# Altium project PCB_Bottom.PrjPcb
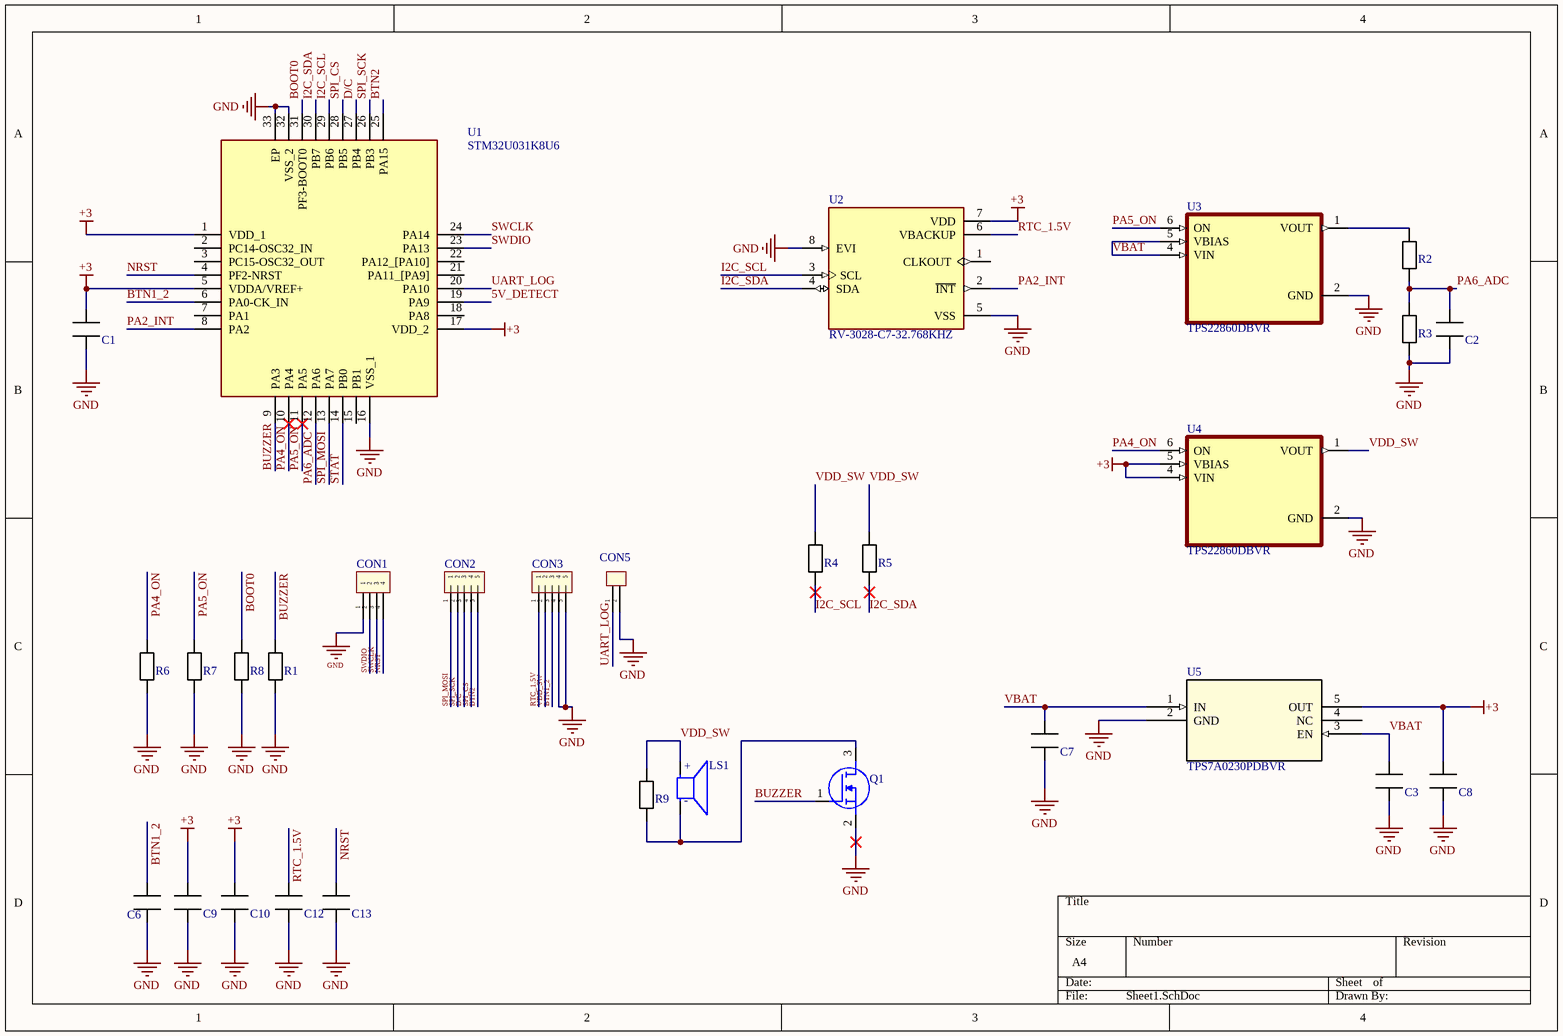
[diagram p0: Sheet1.SchDoc]
2 sheets, 49 parts. Net scope: global (net labels, ports and power ports of the same name join across sheets).
Board file: PCB2.PcbDoc
Sheets:
  Sheet1.SchDoc
  Sheet2.SchDoc

## Sheet Sheet1.SchDoc
size A4; SheetNumber: 1; SheetTotal: 2

### Parts
C1  CAP_0402  [CAP_0402]  (value not drawn)
C2  CAP_0402  [CAP_0402]  (value not drawn)
C3  CAP_0402  [CAP_0402]  (value not drawn)
C6  CAP_0402  [CAP_0402]  (value not drawn)
C7  CAP_0402  [CAP_0402]  (value not drawn)
C8  CAP_0402  [CAP_0402]  (value not drawn)
C9  CAP_0402  [CAP_0402]  (value not drawn)
C10  CAP_0402  [CAP_0402]  (value not drawn)
C12  CAP_0402  [CAP_0402]  (value not drawn)
C13  CAP_0402  [CAP_0402]  (value not drawn)
CON1  CON_1x4_2mm  [CON_1x4_2mm]  (value not drawn)
CON2  CON_1x6_2mm  [CON_1x5_2mm]  (value not drawn)
CON3  CON_1x6_2mm  [CON_1x5_2mm]  (value not drawn)
CON5  1x4 2.54mm THT  [CON_1x2_2mm]  (value not drawn)
LS1  Buzzer_Capacitive_5020  [Buzzer_5020]  (value not drawn)
Q1  c  [SOT50P160X80-3N]  (value not drawn)
R1  RES_0402  [RES_0402]  (value not drawn)
R2  RES_0402  [RES_0402]  (value not drawn)
R3  RES_0402  [RES_0402]  (value not drawn)
R4  RES_0402  [RES_0402]  (value not drawn)
R5  RES_0402  [RES_0402]  (value not drawn)
R6  RES_0402  [RES_0402]  (value not drawn)
R7  RES_0402  [RES_0402]  (value not drawn)
R8  RES_0402  [RES_0402]  (value not drawn)
R9  RES_0402  [RES_0402]  (value not drawn)
U1  STM32U031K8U6  [QFN50P500X500X60-33N-D]
U2  RV-3028-C7-32.768KHZ  [IC_RV-3028-C7-32.768KHZ-1PPM-TA-QA - duplicate]
U3  TPS22860DBVR  [SOT95P280X145-6N]
U4  TPS22860DBVR  [SOT95P280X145-6N]
U5  TPS7A0230PDBVR  [SOT23_DBV_TEX]

### Nets
+3: C1.2 C8.2 C9.1 C10.1 U1.1(VDD_1) U1.5(VDDA/VREF+) U1.17(VDD_2) U2.7(VDD) U4.4(VIN) U4.5(VBIAS) U5.5(OUT)
GND: C1.1 C2.1 C3.1 C6.1 C7.1 C8.1 C9.2 C10.2 C12.2 C13.2 CON1.1 CON3.4 CON3.5 CON5.2 Q1.2(S) R1.1 R3.1 R6.1 R7.1 R8.1 U1.16(VSS_1) U1.32(VSS_2) U1.33(EP) U2.5(VSS) U2.8(EVI) U3.2(GND) U4.2(GND) U5.2(GND)
5V_DETECT: U1.19(PA9)
BOOT0: R8.2 U1.31(PF3-BOOT0)
BTN1_2: C6.2 CON3.3 U1.6(PA0-CK_IN)
BTN2: CON2.5 U1.25(PA15)
BUZZER: Q1.1(G) R1.2 U1.9(PA3)
D/C: CON2.3 U1.27(PB4)
I2C_SCL: R4.1 U1.29(PB6) U2.3(SCL)
I2C_SDA: R5.1 U1.30(PB7) U2.4(SDA)
NRST: C13.1 CON1.4 U1.4(PF2-NRST)
PA2_INT: U1.8(PA2) U2.2(~{INT})
PA4_ON: R6.2 U1.10(PA4) U4.6(ON)
PA5_ON: R7.2 U1.11(PA5) U3.6(ON)
PA6_ADC: C2.2 R2.1 R3.2 U1.12(PA6)
RTC_1.5V: C12.1 CON3.1 U2.6(VBACKUP)
SPI_CS: CON2.4 U1.28(PB5)
SPI_MOSI: CON2.1 U1.13(PA7)
SPI_SCK: CON2.2 U1.26(PB3)
STAT: U1.14(PB0)
SWCLK: CON1.3 U1.24(PA14)
SWDIO: CON1.2 U1.23(PA13)
UART_LOG: CON5.1 U1.20(PA10)
VBAT: C3.2 C7.2 U3.4(VIN) U3.5(VBIAS) U5.1(IN) U5.3(EN)
VDD_SW: CON3.2 LS1.P R4.2 R5.2 R9.2 U4.1(VOUT)
NetLS1_N: LS1.N Q1.3(D) R9.1
NetR2_2: R2.2 U3.1(VOUT)

Not connected (* = marked no-connect by the designer): U1 2(PC14-OSC32_IN) 3(PC15-OSC32_OUT) 7(PA1) 15(PB1) 18(PA8) 21(PA11_[PA9]) 22(PA12_[PA10]); U2 1(CLKOUT); U5 4(NC)

### Notes on the sheet
- (in symbol Buzzer_Capacitive_5020) +; -

### Library data of the parts
C1 C3 C6 C9 C10 C12 C13 = CAP_0402: val: 100n
C2 = CAP_0402: val: 10n
C7 = CAP_0402: val: 1u
C8 = CAP_0402: val: 4.7u
CON2 CON3 = CON_1x5_2mm
CON5 = CON_1x2_2.0mm: CON_1x2_2.54mm_THT; note: any manufacturer; val: 1x4 2.54mm THT
LS1 = Buzzer_Capacitive_5020: Buzzers Transducer, Externally Driven Magnetic 3 V 30mA 4kHz 75dB @ 3V, 10cm Surface Mount Solder Pads; MF: Same Sky; MP: CMT-0502-03-SMT-TR; SnapEDA_Link: https://www.snapeda.com/parts/CMT-0502-03-SMT-TR/Same+Sky/view-part/?ref=snap; Package: Package; Value: *; Check_prices: https://www.snapeda.com/parts/CMT-0502-03-SMT-TR/Same+Sky/view-part/?ref=eda
Q1 = DMG1012T-7: MOSFET N-Channel 20V 0.63A SOT523 | Diodes Inc DMG1012T-7; MF: Diodes Inc.; SnapEDA_Link: https://www.snapeda.com/parts/DMG1012T-7/Diodes+Inc./view-part/?ref=snap; Package: SOT-523 Diodes Inc.; Value: *; MP: DMG1012T-7; Check_prices: https://www.snapeda.com/parts/DMG1012T-7/Diodes+Inc./view-part/?ref=eda
R1 R6 R7 = RES_0402: val: 1M
R2 R3 = RES_0402: val: 100k
R4 R5 = RES_0402: val: 4.7k
R8 = RES_0402: val: 10k
R9 = RES_0402: val: 1k
U1 = STM32U031K8U6: Ultra-low-power features (ultra-low-power devices)  1.71 V to 3.6 V power supply  -40 C to 85/125 C temperature range  VBAT mode: 130 nA (with RTC and 9 x 32-bit backup registers)  Shutdown mode (4 wake-up pins): 16 nA  Standby mode (4 wake-up pins): 160 nA with RTC, 30 nA without RTC  Stop 2 mode: 630 nA with RTC, 515 nA without RTC  Run mode (LDO mode): 52 uA/MHz  Batch acquisition mode (BAM)  4 us wake-up from Stop mode  Brownout reset (BOR); Manufacturer_Name: STMicroelectronics; Geometry.Height: 0.6mm; Manufacturer_Part_Number: STM32U031K8U6; Mouser Part Number: 511-STM32U031K8U6; Mouser Price/Stock: https://www.mouser.co.uk/ProductDetail/STMicroelectronics/STM32U031K8U6?qs=dbcCsuKDzFUeNQ2GzBLCmw%3D%3D; Arrow Part Number: STM32U031K8U6; Arrow Price/Stock: https://www.arrow.com/en/products/stm32u031k8u6/stmicroelectronics.html?utm_currency=USD&region=nac; Datasheet Link: https://www.st.com/resource/en/datasheet/stm32u031f4.pdf
U2 = RV-3028-C7-32.768KHZ-1PPM-TA-QA: Extreme Low Power RTC Module; MF: {'manufacturer': u'Micro Crystal'}; Package: None; Price: None; Value: *; MP: RV-3028-C7-32.768KHZ-1PPM-TA-QA; Availability: Unavailable
U3 U4 = TPS22860DBVR: 0.73-â„¦, 5-V, ultra-low leakage load switch; MF: Texas Instruments; SnapEDA_Link: https://www.snapeda.com/parts/TPS22860DBVR/Texas+Instruments/view-part/?ref=snap; Package: SOT-23-6 Texas Instruments; Value: *; MP: TPS22860DBVR; Check_prices: https://www.snapeda.com/parts/TPS22860DBVR/Texas+Instruments/view-part/?ref=eda
U5 = TPS7A0230PDBVR: 200mA, nanopower-IQ (25 nA), low-dropout (LDO) voltage regulator with enable 5-SOT-23 -40 to 125; Manufacturer_Name: Texas Instruments; Copyright: Copyright (C) 2026 Ultra Librarian. All rights reserved.; Manufacturer_Part_Number: TPS7A0230PDBVR; RefDes: RefDes; Type: Type

## Sheet Sheet2.SchDoc
size A4; SheetNumber: 2; SheetTotal: 2
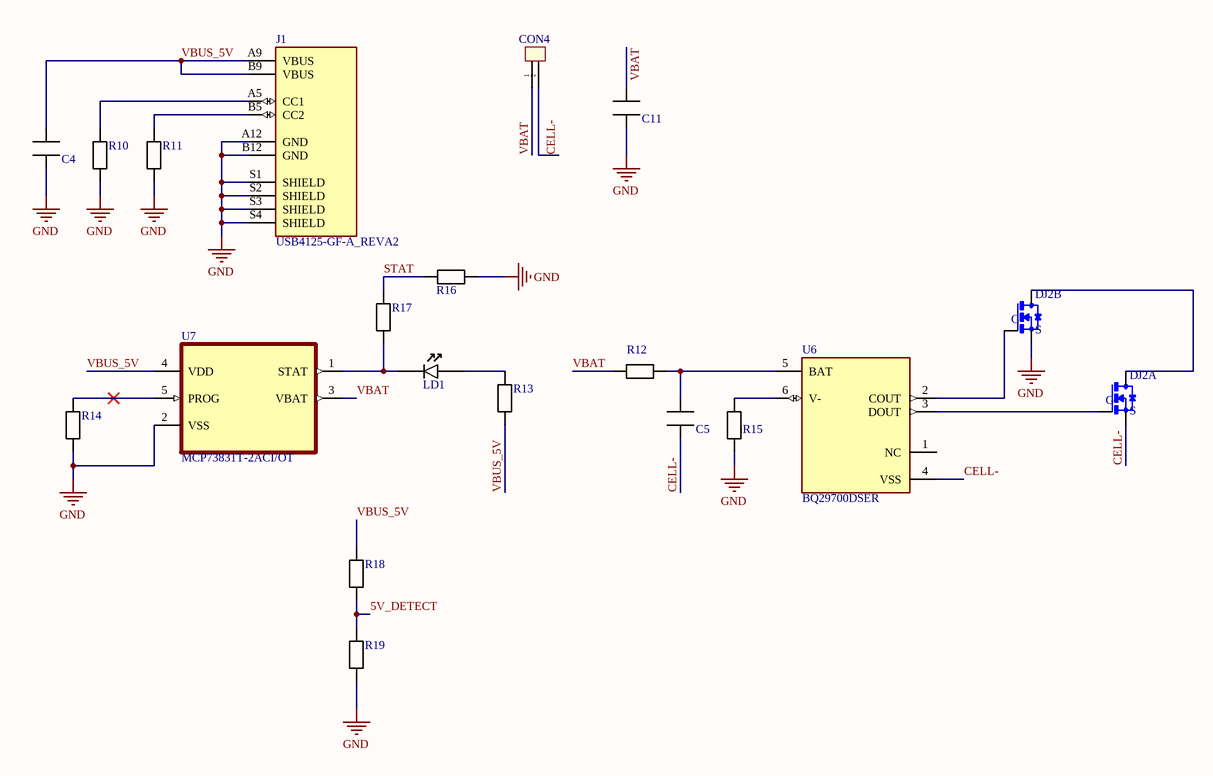
[diagram p1: Sheet2.SchDoc]

### Parts
C4  CAP_0402  [CAP_0402]  (value not drawn)
C5  CAP_0402  [CAP_0402]  (value not drawn)
C11  CAP_0402  [CAP_0402]  (value not drawn)
CON4  1x4 2.54mm THT  [CON_1x2_2.54MM_THT]  (value not drawn)
J1  USB4125-GF-A_REVA2  [GCT_USB4125-GF-A_REVA2]
J2  FDC6305N  [SSOT-6]  (value not drawn)  (parts A,B of 2)
LD1  LED_0402  [LED_0402]  (value not drawn)
R10  RES_0402  [RES_0402]  (value not drawn)
R11  RES_0402  [RES_0402]  (value not drawn)
R12  RES_0402  [RES_0402]  (value not drawn)
R13  RES_0402  [RES_0402]  (value not drawn)
R14  RES_0402  [RES_0402]  (value not drawn)
R15  RES_0402  [RES_0402]  (value not drawn)
R16  RES_0402  [RES_0402]  (value not drawn)
R17  RES_0402  [RES_0402]  (value not drawn)
R18  RES_0402  [RES_0402]  (value not drawn)
R19  RES_0402  [RES_0402]  (value not drawn)
U6  BQ29700DSER  [SON50P150X150X80-6N]
U7  MCP73831T-2ACI/OT  [SOT95P280X145-5N]

### Nets
GND: C4.1 C11.2 J1.A12(GND) J1.B12(GND) J1.S1(SHIELD) J1.S2(SHIELD) J1.S3(SHIELD) J1.S4(SHIELD) J2.2(S) R10.1 R11.1 R14.1 R15.2 R16.1 R19.1 U7.2(VSS)
5V_DETECT: R18.1 R19.2
CELL-: C5.1 CON4.2 J2.5(S) U6.4(VSS)
STAT: R16.2 R17.2
VBAT: C11.1 CON4.1 R12.2 U7.3(VBAT)
VBUS_5V: C4.2 J1.A9(VBUS) J1.B9(VBUS) R13.1 R18.2 U7.4(VDD)
NetC5_2: C5.2 R12.1 U6.5(BAT)
NetJ1_A5: J1.A5(CC1) R10.2
NetJ1_B5: J1.B5(CC2) R11.2
NetJ2_1: J2.1(G) U6.3(DOUT)
NetJ2_3: J2.3(G) U6.2(COUT)
NetJ2_4: J2.4(D) J2.6(D)
NetLD1_1: LD1.1 R17.1 U7.1(STAT)
NetLD1_2: LD1.2 R13.2
NetR14_2: R14.2 U7.5(PROG)
NetR15_1: R15.1 U6.6(V-)

Not connected (* = marked no-connect by the designer): U6 1(NC)

### Library data of the parts
C4 C11 = CAP_0402: val: 4.7u
C5 = CAP_0402: val: 100n
CON4 = CON_1x2_2.54mm_THT: note: any manufacturer; val: 1x4 2.54mm THT
J2 = FDC6305N: Mosfet Array 2 N-Channel (Dual) 20V 2.7A 700mW Surface Mount SuperSOTâ„¢-6; MF: ON Semiconductor; SnapEDA_Link: https://www.snapeda.com/parts/FDC6305N/Onsemi/view-part/?ref=snap; Package: TSOT-23-6 ON Semiconductor; Value: *; MP: FDC6305N; Check_prices: https://www.snapeda.com/parts/FDC6305N/Onsemi/view-part/?ref=eda
R10 R11 = RES_0402: val: 5.1k
R12 = RES_0402: val: 330
R13 = RES_0402: val: 1k
R14 = RES_0402: val: 62k
R15 = RES_0402: val: 2.2k
R16-R19 = RES_0402: val: 100k
U6 = BQ29700DSER: Li-Ion/Li Polymer Advanced Single-Cell Battery Protector IC Family 6-WSON -40 to 85; MF: Texas Instruments; Price: None; Value: *; MP: BQ29700DSER; Availability: Good; SnapEDA_Link: https://www.snapeda.com/parts/BQ29700DSER/Texas%20Instruments/view-part/535836/?ref=snap; Purchase-URL: https://pricing.snapeda.com/search/part/BQ29700DSER/?ref=eda; Package: WSON-6 Texas Instruments
U7 = MCP73831T-2ACI/OT: Charger IC Lithium Ion/Polymer SOT-23-5; MF: Microchip; Package: SOT-23 Microchip; Purchase-URL: https://pricing.snapeda.com/search/part/MCP73831T-2ACI/OT/?ref=eda; MP: MCP73831T-2ACI/OT; Value: *; Availability: In Stock; SnapEDA_Link: https://www.snapeda.com/parts/MCP73831T-2ACI/OT/Microchip/view-part/?ref=snap; Price: None; Check_prices: https://www.snapeda.com/parts/MCP73831T-2ACI/OT/Microchip/view-part/?ref=eda
J1 = USB4125-GF-A_REVA2: Package: None; Availability: Unavailable; MP: USB4125-GF-A_REVA2; Value: *; Price: None

## Nets that join several sheets
GND: Sheet1 (28 pins), Sheet2 (16 pins)
5V_DETECT: Sheet1 (U1.19), Sheet2 (R18.1 R19.2)
STAT: Sheet1 (U1.14), Sheet2 (R16.2 R17.2)
VBAT: Sheet1 (6 pins), Sheet2 (C11.1 CON4.1 R12.2 U7.3)